# Altium schematic sheet Alici_Karti_Blok_Diyagram.SchDoc
size A4; SheetNumber: 2; SheetTotal: 6
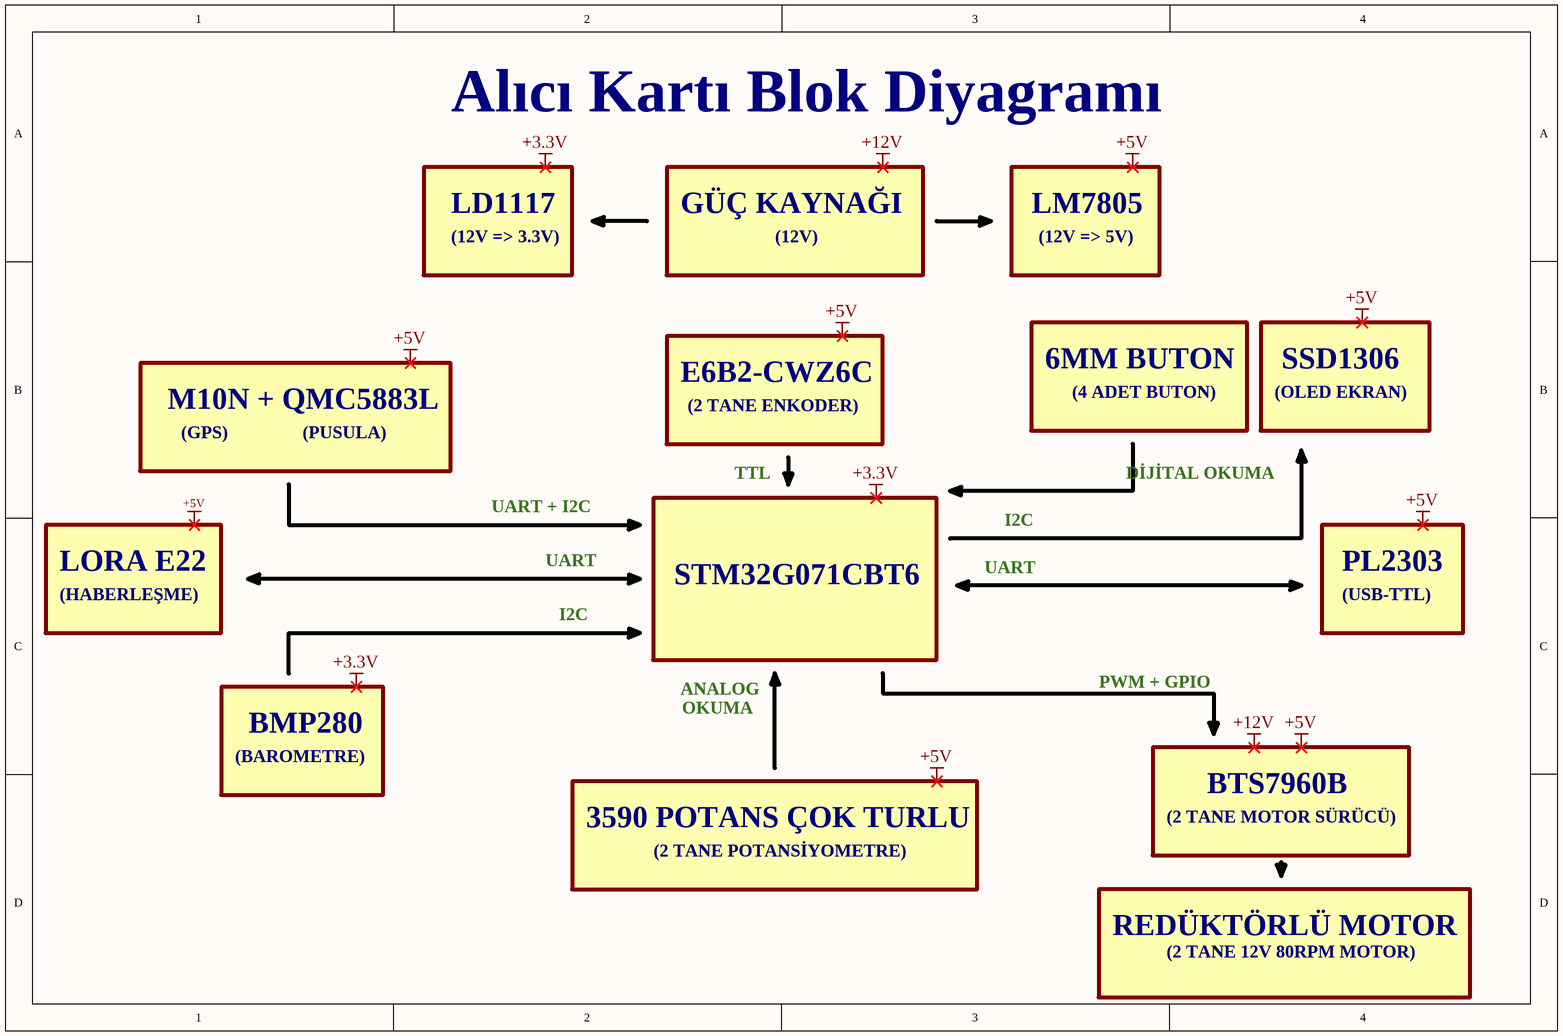
[diagram p0: Alici_Karti_Blok_Diyagram.SchDoc]

## Notes on the sheet
- Alıcı Kartı Blok Diyagramı
- LD1117
- (12V => 3.3V)
- GÜÇ KAYNAĞI
- (12V)
- LM7805
- (12V => 5V)
- E6B2-CWZ6C
- 6MM BUTON
- SSD1306
- M10N + QMC5883L
- (GPS)
- (PUSULA)
- (2 TANE ENKODER)
- (4 ADET BUTON)
- (OLED EKRAN)
- UART + I2C
- TTL
- DİJİTAL OKUMA
- LORA E22
- UART
- I2C
- PL2303
- (HABERLEŞME)
- STM32G071CBT6
- (USB-TTL)
- ANALOG
- OKUMA
- PWM + GPIO
- (BAROMETRE)
- BMP280
- 3590 POTANS ÇOK TURLU
- (2 TANE MOTOR SÜRÜCÜ)
- BTS7960B
- (2 TANE POTANSİYOMETRE)
- REDÜKTÖRLÜ MOTOR
- (2 TANE 12V 80RPM MOTOR)
- Labels drawn without touching a wire or pin: +3.3V, +5V, +12V